# Altium schematic sheet Top_Sheet.SchDoc
size 420 x 297 mm; SheetNumber: 1; SheetTotal: 12
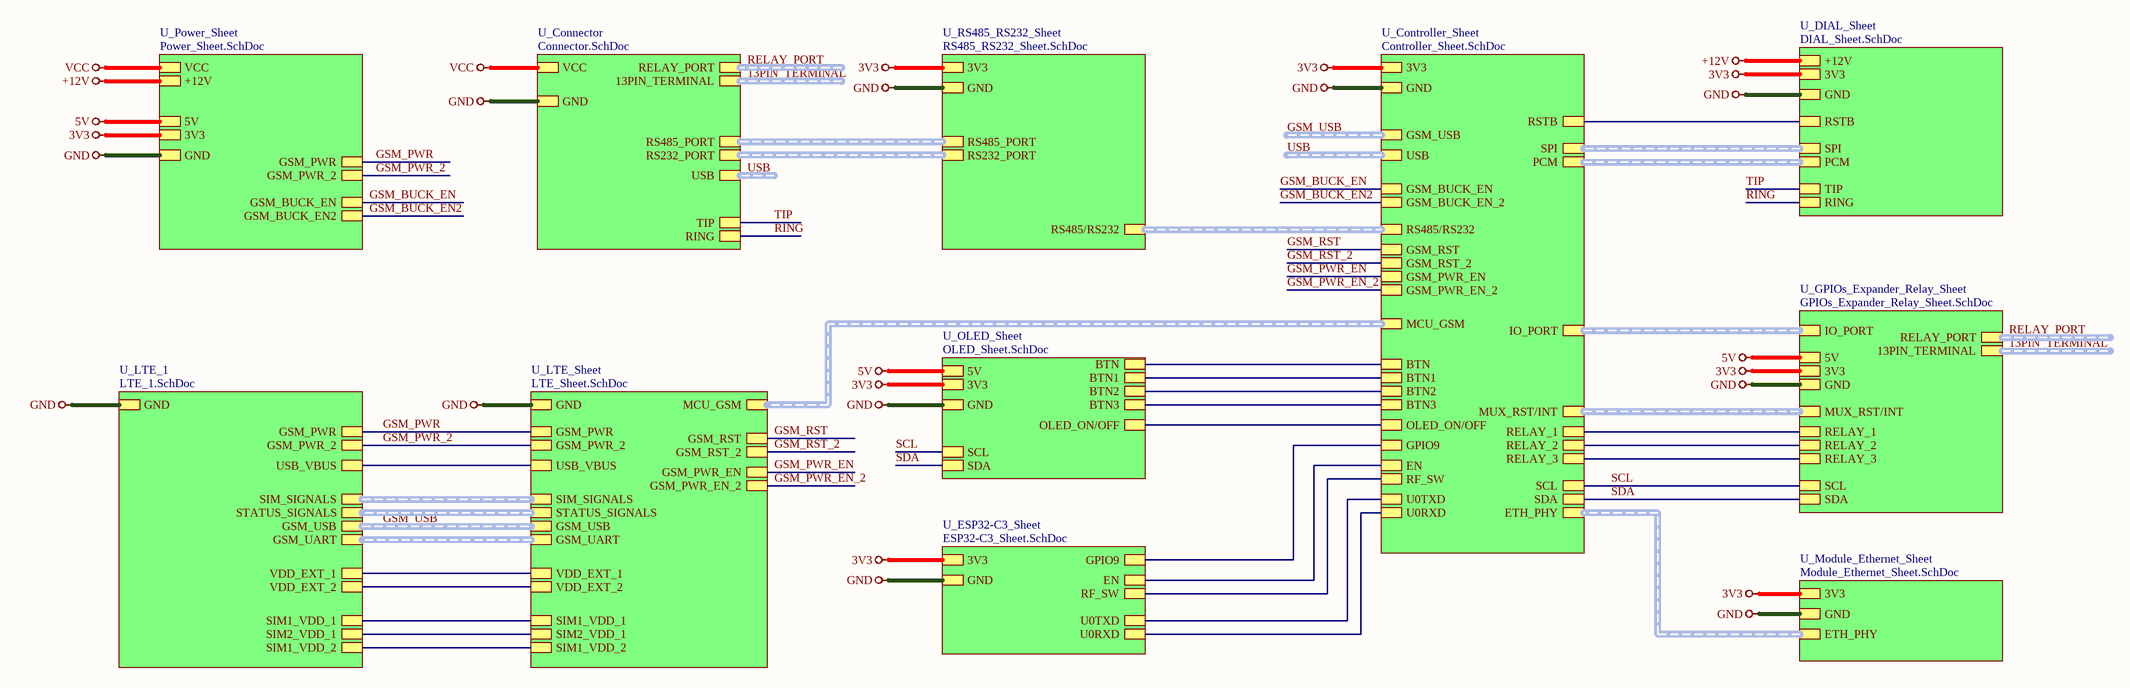
[diagram p0: Top_Sheet.SchDoc]

## Sub-sheets
U_Connector = Connector.SchDoc: VCC, GND, RS485_PORT (harness RS485_PORT), RS232_PORT (harness RS232_PORT), RELAY_PORT (harness RELAY_PORT), 13PIN_TERMINAL (harness 13PIN_TERMINAL), TIP, RING, USB (harness USB)
U_Controller_Sheet = Controller_Sheet.SchDoc: RS485/RS232 (harness RS485/RS232), GND, 3V3, MUX_RST/INT (harness MUX_RST/INT), GSM_USB (harness GSM_USB), ETH_PHY (harness ETH_PHY), GSM_BUCK_EN, GSM_PWR_EN, GSM_RST, RELAY_1, RELAY_2, RELAY_3, MCU_GSM (harness MCU_GSM), GSM_BUCK_EN_2, GSM_PWR_EN_2, GSM_RST_2, RF_SW, EN, BTN1, BTN2, BTN3, OLED_ON/OFF, SCL, SDA, U0RXD, U0TXD, SPI (harness SPI), IO_PORT (harness IO_PORT), PCM (harness PCM), GPIO9, BTN, USB (harness USB), RSTB
U_DIAL_Sheet = DIAL_Sheet.SchDoc: GND, 3V3, +12V, SPI (harness SPI), TIP, RING, PCM (harness PCM), RSTB
U_ESP32-C3_Sheet = ESP32-C3_Sheet.SchDoc: GPIO9, RF_SW, EN, U0RXD, U0TXD, 3V3, GND
U_GPIOs_Expander_Relay_Sheet = GPIOs_Expander_Relay_Sheet.SchDoc: 3V3, GND, 5V, RELAY_PORT (harness RELAY_PORT), 13PIN_TERMINAL (harness 13PIN_TERMINAL), MUX_RST/INT (harness MUX_RST/INT), RELAY_1, RELAY_2, RELAY_3, SCL, SDA, IO_PORT (harness PCM)
U_LTE_1 = LTE_1.SchDoc: SIM_SIGNALS (harness SIM_SIGNALS), SIM1_VDD_1, STATUS_SIGNALS (harness STATUS_SIGNALS), GSM_UART (harness GSM_UART), GSM_PWR, GSM_USB (harness GSM_USB), VDD_EXT_1, GND, USB_VBUS, GSM_PWR_2, SIM2_VDD_1, VDD_EXT_2, SIM1_VDD_2
U_LTE_Sheet = LTE_Sheet.SchDoc: SIM_SIGNALS (harness SIM_SIGNALS), GSM_UART (harness GSM_UART), GSM_PWR, MCU_GSM (harness MCU_GSM), GSM_PWR_EN, GSM_RST, USB_VBUS, GND, STATUS_SIGNALS (harness STATUS_SIGNALS), GSM_PWR_EN_2, GSM_RST_2, GSM_PWR_2, GSM_USB (harness GSM_USB), VDD_EXT_1, VDD_EXT_2, SIM1_VDD_1, SIM2_VDD_1, SIM1_VDD_2
U_Module_Ethernet_Sheet = Module_Ethernet_Sheet.SchDoc: ETH_PHY (harness ETH_PHY), GND, 3V3
U_OLED_Sheet = OLED_Sheet.SchDoc: BTN1, BTN2, BTN3, 3V3, GND, OLED_ON/OFF, SCL, SDA, 5V, BTN
U_Power_Sheet = Power_Sheet.SchDoc: VCC, GND, GSM_BUCK_EN, GSM_PWR, 5V, 3V3, GSM_PWR_2, GSM_BUCK_EN2, +12V
U_RS485_RS232_Sheet = RS485_RS232_Sheet.SchDoc: GND, RS485_PORT (harness RS485_PORT), RS232_PORT (harness RS232_PORT), 3V3, RS485/RS232 (harness RS485/RS232)

## Nets
3V3: sheet U_GPIOs_Expander_Relay_Sheet/3V3, sheet U_OLED_Sheet/3V3, sheet U_Power_Sheet/3V3, sheet U_RS485_RS232_Sheet/3V3, sheet U_Controller_Sheet/3V3, sheet U_ESP32-C3_Sheet/3V3, sheet U_DIAL_Sheet/3V3, sheet U_Module_Ethernet_Sheet/3V3
5V: sheet U_GPIOs_Expander_Relay_Sheet/5V, sheet U_OLED_Sheet/5V, sheet U_Power_Sheet/5V
+12V: sheet U_Power_Sheet/+12V, sheet U_DIAL_Sheet/+12V
GND: sheet U_Connector/GND, sheet U_GPIOs_Expander_Relay_Sheet/GND, sheet U_OLED_Sheet/GND, sheet U_Power_Sheet/GND, sheet U_RS485_RS232_Sheet/GND, sheet U_Controller_Sheet/GND, sheet U_LTE_Sheet/GND, sheet U_LTE_1/GND, sheet U_ESP32-C3_Sheet/GND, sheet U_DIAL_Sheet/GND, sheet U_Module_Ethernet_Sheet/GND
VCC: sheet U_Connector/VCC, sheet U_Power_Sheet/VCC
GSM_BUCK_EN: sheet U_Power_Sheet/GSM_BUCK_EN, sheet U_Controller_Sheet/GSM_BUCK_EN
GSM_BUCK_EN2: sheet U_Power_Sheet/GSM_BUCK_EN2, sheet U_Controller_Sheet/GSM_BUCK_EN_2
GSM_PWR: sheet U_Power_Sheet/GSM_PWR, sheet U_LTE_Sheet/GSM_PWR, sheet U_LTE_1/GSM_PWR
GSM_PWR_2: sheet U_Power_Sheet/GSM_PWR_2, sheet U_LTE_Sheet/GSM_PWR_2, sheet U_LTE_1/GSM_PWR_2
GSM_PWR_EN: sheet U_Controller_Sheet/GSM_PWR_EN, sheet U_LTE_Sheet/GSM_PWR_EN
GSM_PWR_EN_2: sheet U_Controller_Sheet/GSM_PWR_EN_2, sheet U_LTE_Sheet/GSM_PWR_EN_2
GSM_RST: sheet U_Controller_Sheet/GSM_RST, sheet U_LTE_Sheet/GSM_RST
GSM_RST_2: sheet U_Controller_Sheet/GSM_RST_2, sheet U_LTE_Sheet/GSM_RST_2
RING: sheet U_Connector/RING, sheet U_DIAL_Sheet/RING
SCL: sheet U_GPIOs_Expander_Relay_Sheet/SCL, sheet U_OLED_Sheet/SCL, sheet U_Controller_Sheet/SCL
SDA: sheet U_GPIOs_Expander_Relay_Sheet/SDA, sheet U_OLED_Sheet/SDA, sheet U_Controller_Sheet/SDA
TIP: sheet U_Connector/TIP, sheet U_DIAL_Sheet/TIP
(unnamed): sheet U_GPIOs_Expander_Relay_Sheet/RELAY_1, sheet U_Controller_Sheet/RELAY_1
(unnamed): sheet U_GPIOs_Expander_Relay_Sheet/RELAY_2, sheet U_Controller_Sheet/RELAY_2
(unnamed): sheet U_GPIOs_Expander_Relay_Sheet/RELAY_3, sheet U_Controller_Sheet/RELAY_3
(unnamed): sheet U_OLED_Sheet/BTN1, sheet U_Controller_Sheet/BTN1
(unnamed): sheet U_OLED_Sheet/BTN2, sheet U_Controller_Sheet/BTN2
(unnamed): sheet U_OLED_Sheet/BTN3, sheet U_Controller_Sheet/BTN3
(unnamed): sheet U_OLED_Sheet/OLED_ON/OFF, sheet U_Controller_Sheet/OLED_ON/OFF
(unnamed): sheet U_OLED_Sheet/BTN, sheet U_Controller_Sheet/BTN
(unnamed): sheet U_Controller_Sheet/RF_SW, sheet U_ESP32-C3_Sheet/RF_SW
(unnamed): sheet U_Controller_Sheet/EN, sheet U_ESP32-C3_Sheet/EN
(unnamed): sheet U_Controller_Sheet/U0RXD, sheet U_ESP32-C3_Sheet/U0RXD
(unnamed): sheet U_Controller_Sheet/U0TXD, sheet U_ESP32-C3_Sheet/U0TXD
(unnamed): sheet U_Controller_Sheet/GPIO9, sheet U_ESP32-C3_Sheet/GPIO9
(unnamed): sheet U_Controller_Sheet/RSTB, sheet U_DIAL_Sheet/RSTB
(unnamed): sheet U_LTE_Sheet/USB_VBUS, sheet U_LTE_1/USB_VBUS
(unnamed): sheet U_LTE_Sheet/VDD_EXT_1, sheet U_LTE_1/VDD_EXT_1
(unnamed): sheet U_LTE_Sheet/VDD_EXT_2, sheet U_LTE_1/VDD_EXT_2
(unnamed): sheet U_LTE_Sheet/SIM1_VDD_1, sheet U_LTE_1/SIM1_VDD_1
(unnamed): sheet U_LTE_Sheet/SIM2_VDD_1, sheet U_LTE_1/SIM2_VDD_1
(unnamed): sheet U_LTE_Sheet/SIM1_VDD_2, sheet U_LTE_1/SIM1_VDD_2

## Buses and harness runs
harness 13PIN_TERMINAL = sheet U_Connector/13PIN_TERMINAL
harness 13PIN_TERMINAL = sheet U_GPIOs_Expander_Relay_Sheet/13PIN_TERMINAL
harness GSM_USB = sheet U_Controller_Sheet/GSM_USB
harness GSM_USB = sheet U_LTE_1/GSM_USB = sheet U_LTE_Sheet/GSM_USB
harness RELAY_PORT = sheet U_Connector/RELAY_PORT
harness RELAY_PORT = sheet U_GPIOs_Expander_Relay_Sheet/RELAY_PORT
harness sheet U_Connector/RS232_PORT = sheet U_RS485_RS232_Sheet/RS232_PORT
harness sheet U_Connector/RS485_PORT = sheet U_RS485_RS232_Sheet/RS485_PORT
harness sheet U_Controller_Sheet/ETH_PHY = sheet U_Module_Ethernet_Sheet/ETH_PHY
harness sheet U_Controller_Sheet/IO_PORT = sheet U_GPIOs_Expander_Relay_Sheet/IO_PORT
harness sheet U_Controller_Sheet/MCU_GSM = sheet U_LTE_Sheet/MCU_GSM
harness sheet U_Controller_Sheet/MUX_RST/INT = sheet U_GPIOs_Expander_Relay_Sheet/MUX_RST/INT
harness sheet U_Controller_Sheet/PCM = sheet U_DIAL_Sheet/PCM
harness sheet U_Controller_Sheet/RS485/RS232 = sheet U_RS485_RS232_Sheet/RS485/RS232
harness sheet U_Controller_Sheet/SPI = sheet U_DIAL_Sheet/SPI
harness sheet U_LTE_1/GSM_UART = sheet U_LTE_Sheet/GSM_UART
harness sheet U_LTE_1/SIM_SIGNALS = sheet U_LTE_Sheet/SIM_SIGNALS
harness sheet U_LTE_1/STATUS_SIGNALS = sheet U_LTE_Sheet/STATUS_SIGNALS
harness USB = sheet U_Connector/USB
harness USB = sheet U_Controller_Sheet/USB

## Notes on the sheet
- File:
- Title:
- Date:
- Page
- Num:
- Total:
- Drawn By: Huzaifa Ali